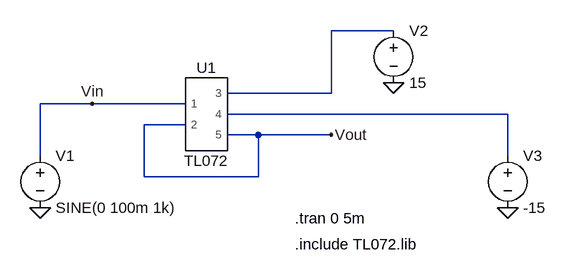
[diagram p0: schematic Teste_TL072.asc]
Teste_TL072.asc, the LTspice schematic file:
Version 4.1
SHEET 1 880 680
WIRE -256 80 -352 80
WIRE -352 176 -352 80
WIRE -352 176 -512 176
WIRE -720 192 -800 192
WIRE -576 192 -720 192
WIRE -80 208 -512 208
WIRE -576 224 -640 224
WIRE -464 240 -512 240
WIRE -352 240 -464 240
WIRE -800 272 -800 192
WIRE -80 272 -80 208
WIRE -640 304 -640 224
WIRE -464 304 -464 240
WIRE -464 304 -640 304
FLAG -352 240 Vout
FLAG -256 160 0
FLAG -800 352 0
FLAG -80 352 0
FLAG -720 192 Vin
SYMBOL TL072 -544 208 R0
SYMATTR InstName U1
SYMBOL voltage -800 256 R0
WINDOW 123 0 0 Left 0
WINDOW 39 0 0 Left 0
SYMATTR InstName V1
SYMATTR Value SINE(0 100m 1k)
SYMBOL voltage -256 64 R0
WINDOW 123 0 0 Left 0
WINDOW 39 0 0 Left 0
SYMATTR InstName V2
SYMATTR Value 15
SYMBOL voltage -80 256 R0
WINDOW 123 0 0 Left 0
WINDOW 39 0 0 Left 0
SYMATTR InstName V3
SYMATTR Value -15
TEXT -408 368 Left 2 !.tran 0 5m
TEXT -408 408 Left 2 !.include TL072.lib

The netlist it stands for:
* Teste_TL072.asc
X§U1 Vin Vout N001 N002 Vout TL072  ; pins 1 2 3 4 5
V1 Vin 0 SINE(0 100m 1k)
V2 N001 0 15
V3 N002 0 -15
.tran 0 5m
.include TL072.lib
.lib TL072.lib
.backanno
.end